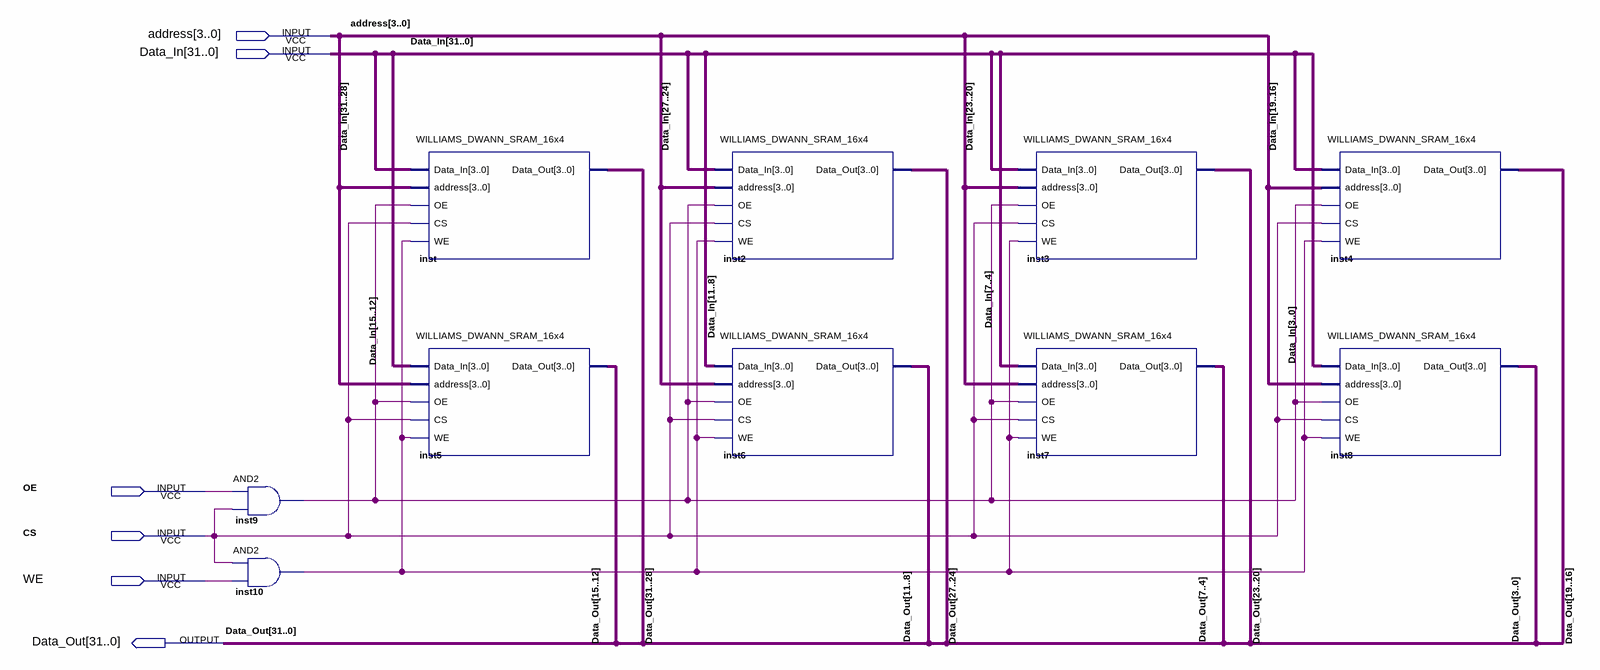
[diagram p0: schematic sheet]
// Quartus schematic WILLIAMS_DWANN_SRAM_16x32.bdf as structural Verilog: 10 symbols, 6 pins
module WILLIAMS_DWANN_SRAM_16x32 (
  input  [3:0] address,
  input  [31:0] Data_In,
  input  OE,
  input  CS,
  input  WE,
  output [31:0] Data_Out
);

  wire inst9_out, inst10_out;

  and inst9 (inst9_out, OE, CS);
  and inst10 (inst10_out, CS, WE);
  WILLIAMS_DWANN_SRAM_16x4 inst (
    .Data_In(Data_In[31:28]), .address(address), .OE(inst9_out), .CS(CS), .WE(inst10_out),
    .Data_Out(Data_Out[31:28]));
  WILLIAMS_DWANN_SRAM_16x4 inst5 (
    .Data_In(Data_In[15:12]), .address(address), .OE(inst9_out), .CS(CS), .WE(inst10_out),
    .Data_Out(Data_Out[15:12]));
  WILLIAMS_DWANN_SRAM_16x4 inst2 (
    .Data_In(Data_In[27:24]), .address(address), .OE(inst9_out), .CS(CS), .WE(inst10_out),
    .Data_Out(Data_Out[27:24]));
  WILLIAMS_DWANN_SRAM_16x4 inst6 (
    .Data_In(Data_In[11:8]), .address(address), .OE(inst9_out), .CS(CS), .WE(inst10_out),
    .Data_Out(Data_Out[11:8]));
  WILLIAMS_DWANN_SRAM_16x4 inst3 (
    .Data_In(Data_In[23:20]), .address(address), .OE(inst9_out), .CS(CS), .WE(inst10_out),
    .Data_Out(Data_Out[23:20]));
  WILLIAMS_DWANN_SRAM_16x4 inst7 (
    .Data_In(Data_In[7:4]), .address(address), .OE(inst9_out), .CS(CS), .WE(inst10_out),
    .Data_Out(Data_Out[7:4]));
  WILLIAMS_DWANN_SRAM_16x4 inst4 (
    .Data_In(Data_In[19:16]), .address(address), .OE(inst9_out), .CS(CS), .WE(inst10_out),
    .Data_Out(Data_Out[19:16]));
  WILLIAMS_DWANN_SRAM_16x4 inst8 (
    .Data_In(Data_In[3:0]), .address(address), .OE(inst9_out), .CS(CS), .WE(inst10_out),
    .Data_Out(Data_Out[3:0]));
endmodule
